# Altium schematic sheet MIPI.SchDoc
size A3; SheetNumber: 13; SheetTotal: 13
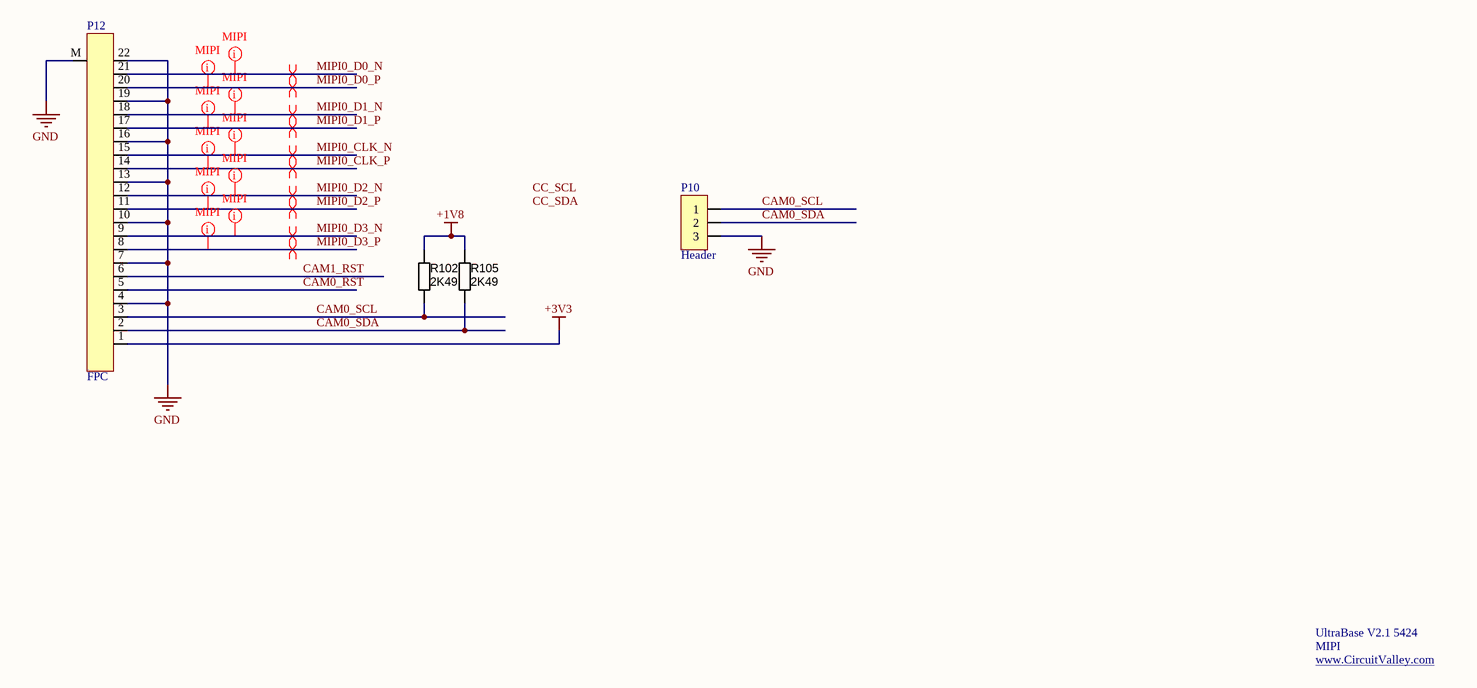
[diagram p0: MIPI.SchDoc]

## Parts
P10  Header  [Header3x]
P12  FPC  [AFC11-S22ICA-00]
R102  value 2K49  [RESC1608N]  (hidden comment: RES_NL_0603)
R105  value 2K49  [RESC1608N]  (hidden comment: RES_NL_0603)

## Nets
+1V8: R102.2 R105.2
+3V3: P12.1
GND: P10.3 P12.4 P12.7 P12.10 P12.13 P12.16 P12.19 P12.22 P12.M
CAM0_RST: P12.5
CAM0_SCL: P10.1 P12.3 R102.1
CAM0_SDA: P10.2 P12.2 R105.1
CAM1_RST: P12.6
MIPI0_CLK_N: P12.15
MIPI0_CLK_P: P12.14
MIPI0_D0_N: P12.21
MIPI0_D0_P: P12.20
MIPI0_D1_N: P12.18
MIPI0_D1_P: P12.17
MIPI0_D2_N: P12.12
MIPI0_D2_P: P12.11
MIPI0_D3_N: P12.9
MIPI0_D3_P: P12.8

## Layout directives
differential pair: MIPI0_CLK_N, MIPI0_CLK_P, MIPI0_D0_N, MIPI0_D0_P, MIPI0_D1_N, MIPI0_D1_P, MIPI0_D2_N, MIPI0_D2_P, MIPI0_D3_N, MIPI0_D3_P
net class MIPI: MIPI0_CLK_N, MIPI0_CLK_P, MIPI0_D0_N, MIPI0_D0_P, MIPI0_D1_N, MIPI0_D1_P, MIPI0_D2_N, MIPI0_D2_P, MIPI0_D3_N, MIPI0_D3_P

## Notes on the sheet
- UltraBase V2.1 5424
- MIPI
- www.CircuitValley.com <http://www.CircuitValley.com>
- Labels drawn without touching a wire or pin: CC_SCL, CC_SDA

## Library data of the parts
P10 = Header_3Pin: 3 Pin Header; Value: NC
P12 = FPC22_PIN: FPC 22 Pin
R102 R105 = RES_NL_0603: Resistor, SMD chip; Manufacturer 1: Royal Ohm; Ratings: 1/10 W; Tolerance: ±5%; Package / Case: 0603 (1608 metric)